# Altium project Base V3.PrjPcb
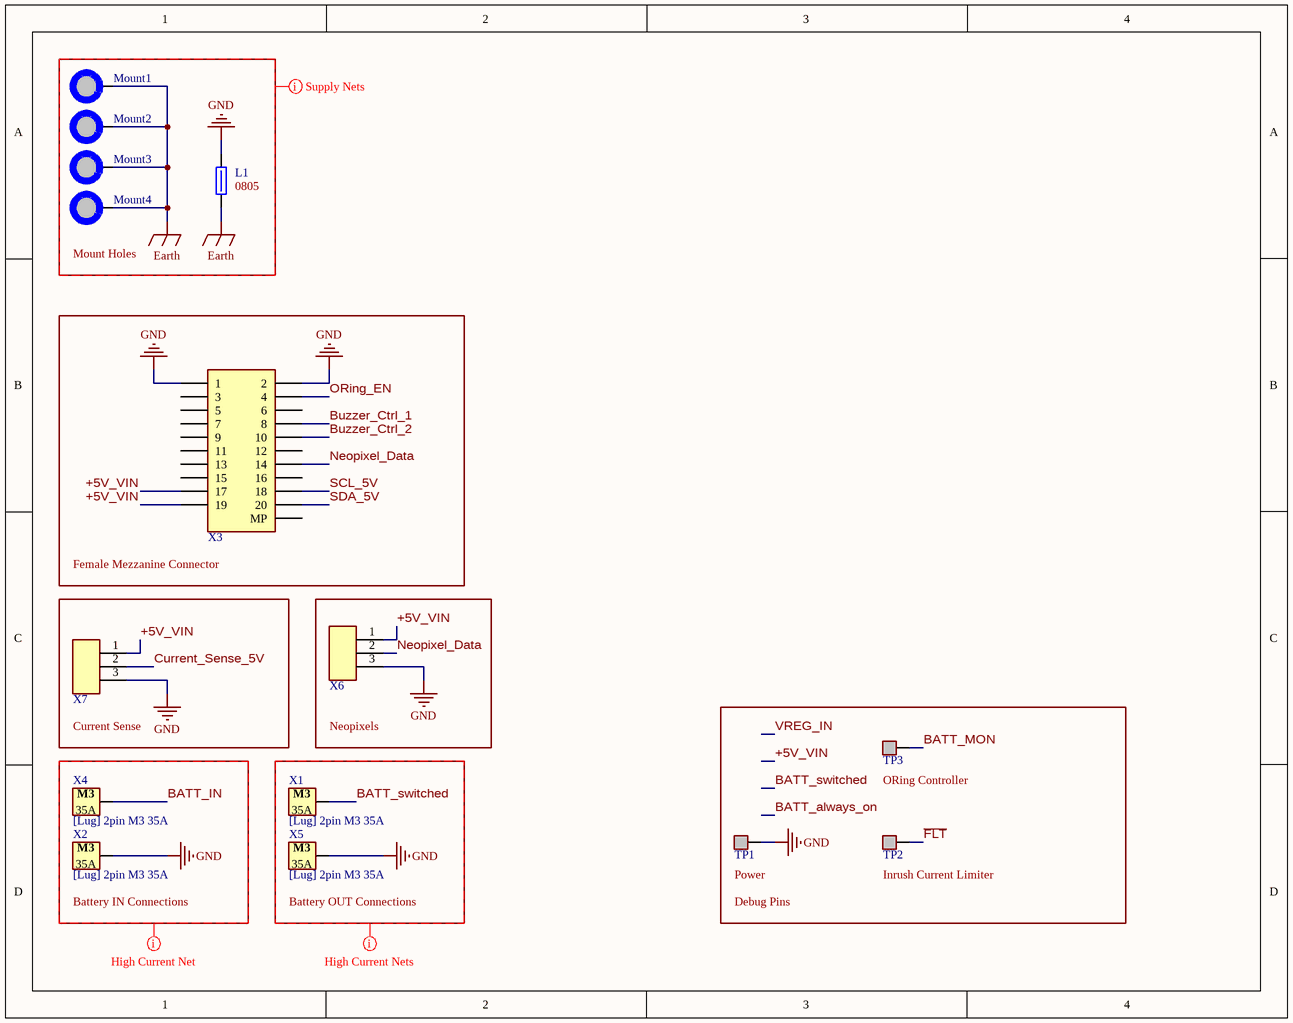
[diagram p0: Connections.SchDoc]
5 sheets, 69 parts. Net scope: global (net labels, ports and power ports of the same name join across sheets).
Board file: Layout.PcbDoc
Sheets:
  Connections.SchDoc
  Power.SchDoc
  ORing.SchDoc
  Buzzer.SchDoc
  Current Sensor ADC.SchDoc

## Sheet Connections.SchDoc
size A; SheetNumber: 1; SheetTotal: 5

### Parts
L1  Size Package: 0805  [[Ferrite] SMD 0805]  (hidden comment: 652-MH2029-300Y)
Mount1  M3 Mount Hole  [[Mount] M3 Mount Hole]  (value not drawn)  (no BOM)
Mount2  M3 Mount Hole  [[Mount] M3 Mount Hole]  (value not drawn)  (no BOM)
Mount3  M3 Mount Hole  [[Mount] M3 Mount Hole]  (value not drawn)  (no BOM)
Mount4  M3 Mount Hole  [[Mount] M3 Mount Hole]  (value not drawn)  (no BOM)
TP1  [THM] Thru-Hole  [[THM] White]  (value not drawn)
TP2  [THM] Thru-Hole  [[THM] White]  (value not drawn)
TP3  [THM] Thru-Hole  [[THM] White]  (value not drawn)
X1  [Lug] 2pin M3 35A  [[Lug] 2pin M3 35A]
X2  [Lug] 2pin M3 35A  [[Lug] 2pin M3 35A]
X3  [Mezzanine] 20pin 0.4mm Female  [[Mezzanine] 20pin 0.4mm Female]  (value not drawn)
X4  [Lug] 2pin M3 35A  [[Lug] 2pin M3 35A]
X5  [Lug] 2pin M3 35A  [[Lug] 2pin M3 35A]
X6  [Sherlock] 3pin 90deg  [[Sherlock] 3pin 90deg]  (value not drawn)
X7  [Sherlock] 3pin 90deg  [[Sherlock] 3pin 90deg]  (value not drawn)

### Blocks framed on the sheet
Mount Holes: L1 Mount1-Mount4
Female Mezzanine Connector: X3
Current Sense: X7
Neopixels: X6
Battery IN Connections: X2 X4
Battery OUT Connections: X1 X5

### Nets
Earth: L1.1 Mount1.1 Mount2.1 Mount3.1 Mount4.1
GND: L1.2 TP1.1 X2.1 X3.1 X3.2 X5.1 X6.3 X7.3
+5V_VIN: X3.17 X3.19 X6.1 X7.1
~{FLT}: TP2.1
BATT_IN: X4.1
BATT_MON: TP3.1
BATT_switched: X1.1
Buzzer_Ctrl_1: X3.8
Buzzer_Ctrl_2: X3.10
Current_Sense_5V: X7.2
Neopixel_Data: X3.14 X6.2
ORing_EN: X3.4
SCL_5V: X3.18
SDA_5V: X3.20

Not connected (* = marked no-connect by the designer): X3 3 5 6 7 9 11 12 13 15 16 MP

### Layout directives
net class Supply_Nets: Earth, GND
net class High_Current_Nets: BATT_IN, BATT_switched, GND

### Notes on the sheet
- (near TP3) ORing Controller
- Debug Pins
- (near TP1) Power
- (near TP2) Inrush Current Limiter

### Library data of the parts
L1 = [Ferrite] SMD 0805 3A 30ohm: Res @ Freq: 30 @ 100MHz; Supplier 1: DigiKey; Supplier Part Number 1: MH2029-300YCT-ND
Mount1-Mount4 = [Mount] M3 Mount Hole: Place at least 4.5mm from board edge. Plated.
TP1-TP3 = [THM] Thru-Hole: 5012; Supplier 1: DigiKey; Supplier Part Number 1: 36-5012-ND
X1 X2 X4 X5 = [Lug] 2pin M3 35A: AMT0230003TH0000G; Supplier 1: DigiKey; Supplier Part Number 1: 1818-AMT0230003TH0000G-ND
X3 = [Mezzanine] 20pin 0.4mm Female: DF40C-20DP-0.4V(51); System: Connector; Supplier 1: DigiKey; Supplier Part Number 1: H11618CT-ND
X6 X7 = [Sherlock] 3pin 90deg: 0353630360; Supplier 1: DigiKey; Supplier Part Number 1: WM18932-ND

## Sheet Power.SchDoc
size B; SheetNumber: 2; SheetTotal: 5
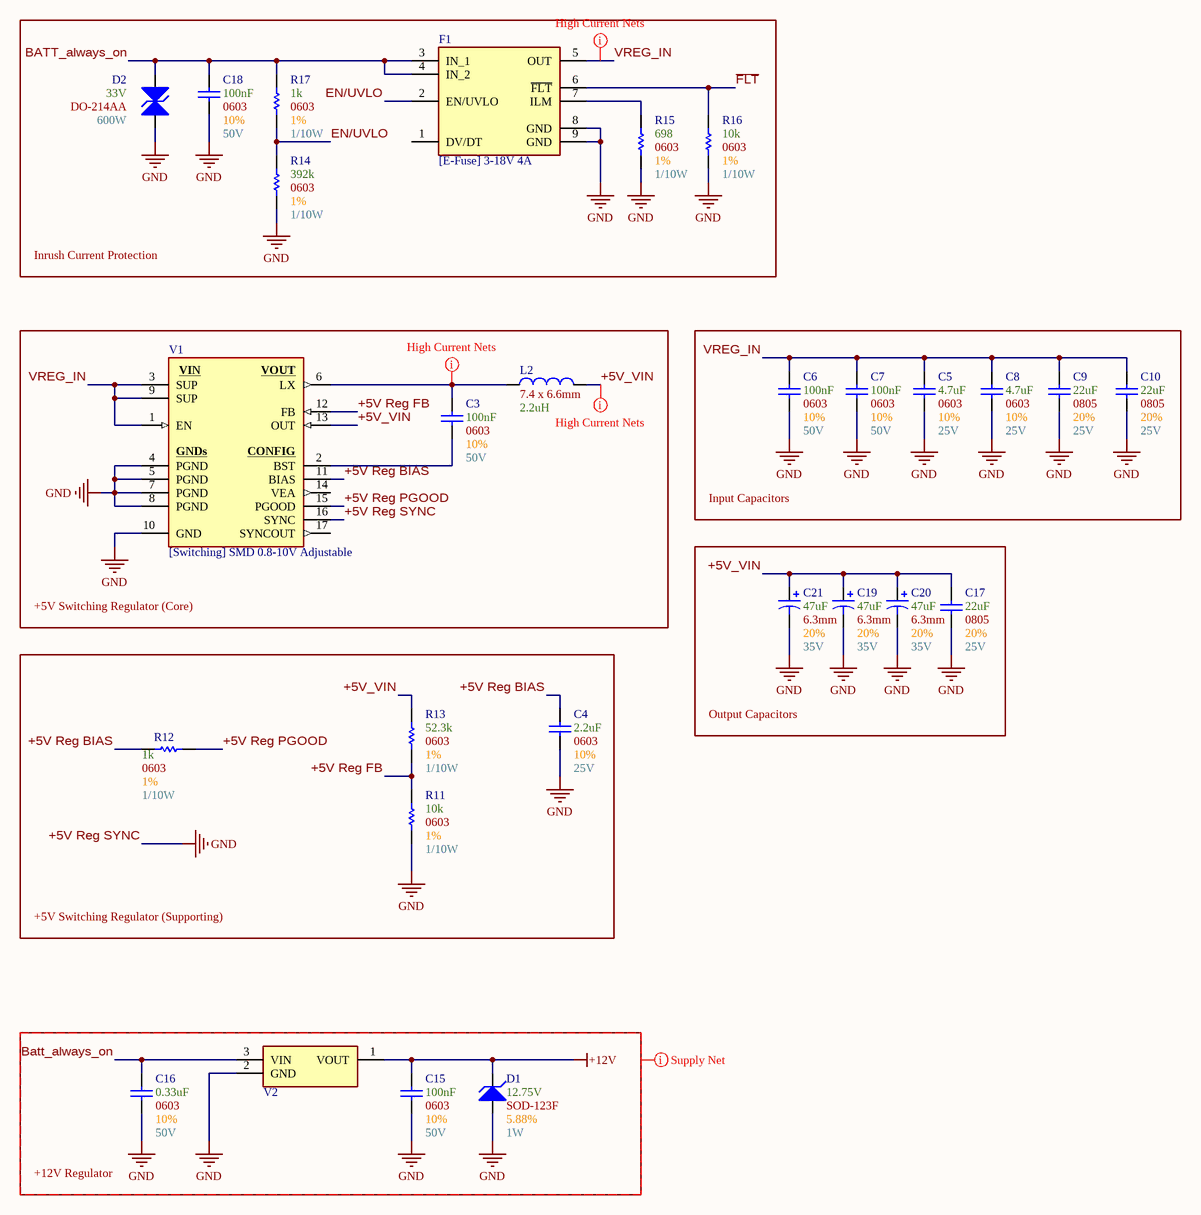
[diagram p1: Power.SchDoc]

### Parts
C3  Max Voltage: 50V  Size Package: 0603  Tolerance: 10%  Capacitance: 100nF  [[Cap] SMD 0603]  (hidden comment: [Cap] 0603 0.1uF 10% 50V)
C4  Max Voltage: 25V  Size Package: 0603  Tolerance: 10%  Capacitance: 2.2uF  [[Cap] SMD 0603]  (hidden comment: [Cap] 0603 2.2uF 10% 25V)
C5  Max Voltage: 25V  Size Package: 0603  Tolerance: 10%  Capacitance: 4.7uF  [[Cap] SMD 0603]  (hidden comment: [Cap] 0603 4.7uF 10% 25V)
C6  Max Voltage: 50V  Size Package: 0603  Tolerance: 10%  Capacitance: 100nF  [[Cap] SMD 0603]  (hidden comment: [Cap] 0603 0.1uF 10% 50V)
C7  Max Voltage: 50V  Size Package: 0603  Tolerance: 10%  Capacitance: 100nF  [[Cap] SMD 0603]  (hidden comment: [Cap] 0603 0.1uF 10% 50V)
C8  Max Voltage: 25V  Size Package: 0603  Tolerance: 10%  Capacitance: 4.7uF  [[Cap] SMD 0603]  (hidden comment: [Cap] 0603 4.7uF 10% 25V)
C9  Max Voltage: 25V  Size Package: 0805  Tolerance: 20%  Capacitance: 22uF  [[Cap] SMD 0805]  (hidden comment: [Cap] 0805 22uF 20% 25V)
C10  Max Voltage: 25V  Size Package: 0805  Tolerance: 20%  Capacitance: 22uF  [[Cap] SMD 0805]  (hidden comment: [Cap] 0805 22uF 20% 25V)
C15  Max Voltage: 50V  Size Package: 0603  Tolerance: 10%  Capacitance: 100nF  [[Cap] SMD 0603]  (hidden comment: [Cap] 0603 0.1uF 10% 50V)
C16  Max Voltage: 50V  Size Package: 0603  Tolerance: 10%  Capacitance: 0.33uF  [[Cap] SMD 0603]  (hidden comment: [Cap] 0603 0.33uF 10% 50V)
C17  Max Voltage: 25V  Size Package: 0805  Tolerance: 20%  Capacitance: 22uF  [[Cap] SMD 0805]  (hidden comment: [Cap] 0805 22uF 20% 25V)
C18  Max Voltage: 50V  Size Package: 0603  Tolerance: 10%  Capacitance: 100nF  [[Cap] SMD 0603]  (hidden comment: [Cap] 0603 0.1uF 10% 50V)
C19  Max Voltage: 35V  Size Package: 6.3mm  Tolerance: 20%  Capacitance: 47uF  [[Cap] SMD Polarized, 6.3mm]  (hidden comment: [Cap] 6.3mm 47uF 20% 35V)
C20  Max Voltage: 35V  Size Package: 6.3mm  Tolerance: 20%  Capacitance: 47uF  [[Cap] SMD Polarized, 6.3mm]  (hidden comment: [Cap] 6.3mm 47uF 20% 35V)
C21  Max Voltage: 35V  Size Package: 6.3mm  Tolerance: 20%  Capacitance: 47uF  [[Cap] SMD Polarized, 6.3mm]  (hidden comment: [Cap] 6.3mm 47uF 20% 35V)
D1  Tolerance: 5.88%  Wattage: 1W  Optimal Zener Voltage: 12.75V  [[Diode] SOD-123F]  (hidden comment: SOD-123F)
D2  Wattage: 600W  Optimal Zener Voltage: 33V  [[Diode] SMD DO-214AA]  (hidden comment: DO-214AA)
F1  [E-Fuse] 3-18V 4A  [[E-Fuse] 3-18V 4A]
L2  Package: 7.4 x 6.6mm  Inductance: 2.2uH  [[Inductor] SMD 7.4 X 6.6 X 3 MM]  (hidden comment: [2.2uH] SMD Nonstandard 10A)
R11  Wattage: 1/10W  Tolerance: 1%  Resistance: 10k  Size Package: 0603  [[Res] SMD 0603]  (hidden comment: [10k] SMD 0603 1% 1/8W)
R12  Wattage: 1/10W  Tolerance: 1%  Resistance: 1k  Size Package: 0603  [[Res] SMD 0603]  (hidden comment: [1k] SMD 0603 1% 1/10W)
R13  Wattage: 1/10W  Tolerance: 1%  Resistance: 52.3k  Size Package: 0603  [[Res] SMD 0603]  (hidden comment: [52.3k] SMD 0603 1% 1/10W)
R14  Wattage: 1/10W  Tolerance: 1%  Resistance: 392k  Size Package: 0603  [[Res] SMD 0603]  (hidden comment: [392k] SMD 0603 1% 1/10W)
R15  Wattage: 1/10W  Tolerance: 1%  Resistance: 698  Size Package: 0603  [[Res] SMD 0603]  (hidden comment: [698] SMD 0603 1% 1/10W_1)
R16  Wattage: 1/10W  Tolerance: 1%  Resistance: 10k  Size Package: 0603  [[Res] SMD 0603]  (hidden comment: [10k] SMD 0603 1% 1/8W)
R17  Wattage: 1/10W  Tolerance: 1%  Resistance: 1k  Size Package: 0603  [[Res] SMD 0603]  (hidden comment: [1k] SMD 0603 1% 1/10W)
V1  [Switching] SMD 0.8-10V Adjustable  [[Switching] 0.8-10V Adjustable Buck]
V2  [Linear] SMD 12V 0.1A  [[Linear] SMD 12V 0.1A]  (value not drawn)

### Blocks framed on the sheet
Inrush Current Protection: C18 D2 F1 R14-R17
+5V Switching Regulator (Core): C3 L2 V1
Input Capacitors: C5-C10
Output Capacitors: C17 C19-C21
+5V Switching Regulator (Supporting): C4 R11-R13
+12V Regulator: C15 C16 D1 V2

### Nets
+12V: C15.2 D1.1(K) V2.1(VOUT)
GND: C4.1 C5.1 C6.1 C7.1 C8.1 C9.1 C10.1 C15.1 C16.1 C17.1 C18.1 C19.2 C20.2 C21.2 D1.2(A) D2.1(A) F1.8(GND) F1.9(GND) R11.1 R14.1 R15.1 R16.1 V1.4(PGND) V1.5(PGND) V1.7(PGND) V1.8(PGND) V1.10(GND) V1.16(SYNC) V2.2(GND)  [also labelled +5V Reg SYNC]
+5V Reg BIAS: C4.2 R12.1 V1.11(BIAS)
+5V Reg FB: R11.2 R13.1 V1.12(FB)
+5V Reg PGOOD: R12.2 V1.15(PGOOD)
+5V_VIN: C17.2 C19.1 C20.1 C21.1 L2.2 R13.2 V1.13(OUT)
~{FLT}: F1.6(~{FLT}) R16.2
BATT_always_on: C16.2 C18.2 D2.2(K) F1.3(IN_1) F1.4(IN_2) R17.2 V2.3(VIN)
EN/UVLO: F1.2(EN/UVLO) R14.2 R17.1
VREG_IN: C5.2 C6.2 C7.2 C8.2 C9.2 C10.2 F1.5(OUT) V1.1(EN) V1.3(SUP) V1.9(SUP)
NetC3_1: C3.1 V1.2(BST)
NetC3_2: C3.2 L2.1 V1.6(LX)
NetF1_7: F1.7(ILM) R15.2

Not connected (* = marked no-connect by the designer): F1 1(DV/DT); V1 14(VEA) 17(SYNCOUT)

### Layout directives
net class High_Current_Nets: +5V_VIN, NetC3_2, VREG_IN
net class Supply_Nets: +12V, Batt_always_on, GND

### Library data of the parts
C3 C6 C7 C15 C18 = [Cap] 0603 0.1uF 10% 50V: CL10B104KB8NNNC; Supplier 1: DigiKey; Supplier Part Number 1: 1276-1000-6-ND
C4 = [Cap] 0603 2.2uF 10% 25V: GRM188R61E225KA12D; Supplier 1: DigiKey; Supplier Part Number 1: 490-10731-1-ND
C5 C8 = [Cap] 0603 4.7uF 10% 25V: GRM188R61E475KE11D; Supplier 1: DigiKey; Supplier Part Number 1: 490-7203-6-ND
C9 C10 C17 = [Cap] 0805 22uF 20% 25V: CL21A226MAYNNWE; Supplier 1: DigiKey; Supplier Part Number 1: 1276-CL21A226MAYNNWECT-ND
C16 = [Cap] 0603 0.33uF 10% 50V: CGA3E3X7R1H334K080AB; Supplier 1: DigiKey; Supplier Part Number 1: 445-174426-1-ND
C19-C21 = [Cap] 6.3mm 47uF 20% 35V: UWT1V470MCL1GS; Supplier 1: DigiKey; Supplier Part Number 1: 493-2202-1-ND
D1 = [Zener] SMD 12.75V 1W 5.88%: KDZVTR12B; Supplier 1: DigiKey; Supplier Part Number 1: KDZVTR12BCT-ND; Footprint: SOD-123F
D2 = [TVS] SMBJ33CA: SMBJ33CA; Supplier 1: DigiKey; Supplier Part Number 1: SMBJ33CA-FDICT-ND; Footprint: DO-214AA
F1 = [E-Fuse] 3-18V 4A: TPS259571DSGR; Supplier 1: DigiKey; Supplier Part Number 1: 296-50500-1-ND
L2 = [2.2uH] SMD Nonstandard 10A: ECS-MPIL0630-2R2MC; Supplier 1: DigiKey; Supplier Part Number 1: XC2402CT-ND
R11 R16 = [10k] SMD 0603 1% 1/8W: RMCF0603FT10K0; Supplier 1: DigiKey; Supplier Part Number 1: RMCF0603FT10K0DKR-ND
R12 R17 = [1k] SMD 0603 1% 1/10W: RMCF0603FT1K00; Supplier 1: DigiKey; Supplier Part Number 1: RMCF0603FT1K00DKR-ND
R13 = [52.3k] SMD 0603 1% 1/10W: RC0603FR-0752K3L; Supplier 1: DigiKey; Supplier Part Number 1: 311-52.3KHRCT-ND
R14 = [392k] SMD 0603 1% 1/10W: CR0603-FX-3923ELF; Supplier 1: DigiKey; Supplier Part Number 1: 118-CR0603-FX-3923ELFCT-ND
R15 = [698] SMD 0603 1% 1/10W_1: RMCF0603FT698R; Supplier 1: DigiKey; Supplier Part Number 1: RMCF0603FT698RCT-ND
V1 = [Switching] SMD 0.8-10V Adjustable: MAX20408AFOF/VY+; Supplier 1: DigiKey; Supplier Part Number 1: 505-MAX20408AFOF/VY+-ND
V2 = [Linear] SMD 12V 0.1A: L78L12ACUTR; Supplier 1: DigiKey; Supplier Part Number 1: 497-1195-1-ND

## Sheet ORing.SchDoc
size A; SheetNumber: 3; SheetTotal: 5
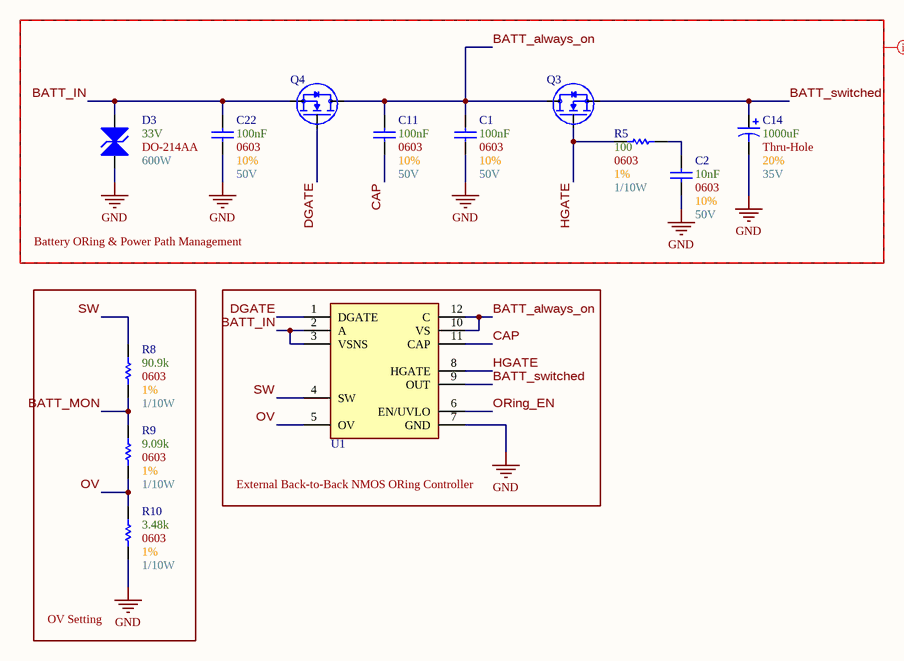
[diagram p2: ORing.SchDoc]

### Parts
C1  Max Voltage: 50V  Size Package: 0603  Tolerance: 10%  Capacitance: 100nF  [[Cap] SMD 0603]  (hidden comment: [Cap] 0603 0.1uF 10% 50V)
C2  Max Voltage: 50V  Size Package: 0603  Tolerance: 10%  Capacitance: 10nF  [[Cap] SMD 0603]  (hidden comment: [Cap] 0603 0.01uF 10% 50V)
C11  Max Voltage: 50V  Size Package: 0603  Tolerance: 10%  Capacitance: 100nF  [[Cap] SMD 0603]  (hidden comment: [Cap] 0603 0.1uF 10% 50V)
C14  Max Voltage: 35V  Size Package: Thru-Hole  Tolerance: 20%  Capacitance: 1000uF  [[Cap] Thru-Hole Polarized 10mm]  (hidden comment: [Cap] Thru-Hole 1000uF 20% 35V)
C22  Max Voltage: 50V  Size Package: 0603  Tolerance: 10%  Capacitance: 100nF  [[Cap] SMD 0603]  (hidden comment: [Cap] 0603 0.1uF 10% 50V)
D3  Wattage: 600W  Optimal Zener Voltage: 33V  [[Diode] SMD DO-214AA]  (hidden comment: DO-214AA)
Q3  [NMOS] SMD 40V 175A 0.55mOhm  [[NMOS] SMD 40V 175A 0.55mOhm]  (value not drawn)
Q4  [NMOS] SMD 40V 175A 0.55mOhm  [[NMOS] SMD 40V 175A 0.55mOhm]  (value not drawn)
R5  Wattage: 1/10W  Tolerance: 1%  Resistance: 100  Size Package: 0603  [[Res] SMD 0603]  (hidden comment: [100] SMD 0603 1% 1/10W)
R8  Wattage: 1/10W  Tolerance: 1%  Resistance: 90.9k  Size Package: 0603  [[Res] SMD 0603]  (hidden comment: [90.9k] SMD 0603 1% 1/10W)
R9  Wattage: 1/10W  Tolerance: 1%  Resistance: 9.09k  Size Package: 0603  [[Res] SMD 0603]  (hidden comment: [9.09k] SMD 0603 1% 1/10W)
R10  Wattage: 1/10W  Tolerance: 1%  Resistance: 3.48k  Size Package: 0603  [[Res] SMD 0603]  (hidden comment: [3.48k] SMD 0603 1% 1/10W_1)
U1  [ORing] Back-to-Back External NMOS Controller  [[ORing] Back-to-Back External NMOS Controller]  (value not drawn)

### Blocks framed on the sheet
Battery ORing & Power Path Management: C1 C2 C11 C14 C22 D3 Q3 Q4 R5
OV Setting: R8-R10
External Back-to-Back NMOS ORing Controller: U1

### Nets
GND: C1.1 C2.1 C14.2 C22.1 D3.1(A) R10.2 U1.7(GND)
BATT_always_on: C1.2 C11.2 Q3.3(Drain) Q4.3(Drain) U1.10(VS) U1.12(C)
BATT_IN: C22.2 D3.2(K) Q4.1(Source) U1.2(A) U1.3(VSNS)
BATT_MON: R8.1 R9.2
BATT_switched: C14.1 Q3.1(Source) U1.9(OUT)
CAP: C11.1 U1.11(CAP)
DGATE: Q4.2(Gate) U1.1(DGATE)
HGATE: Q3.2(Gate) R5.1 U1.8(HGATE)
ORing_EN: U1.6(EN/UVLO)
OV: R9.1 R10.1 U1.5(OV)
SW: R8.2 U1.4(SW)
NetC2_2: C2.2 R5.2

### Layout directives
net class High_Current_Nets: BATT_always_on, BATT_IN, BATT_switched, CAP, DGATE, GND, HGATE

### Library data of the parts
C1 C11 C22 = [Cap] 0603 0.1uF 10% 50V: CL10B104KB8NNNC; Supplier 1: DigiKey; Supplier Part Number 1: 1276-1000-6-ND
C2 = [Cap] 0603 0.01uF 10% 50V: C0603C103K5RACTU; Supplier 1: DigiKey; Supplier Part Number 1: 399-C0603C103K5RACTUDKR-ND
C14 = [Cap] Thru-Hole 1000uF 20% 35V: 35PK1000MEFC10X20; Supplier 1: DigiKey; Supplier Part Number 1: 1189-1742-ND
D3 = [TVS] SMBJ33CA: SMBJ33CA; Supplier 1: DigiKey; Supplier Part Number 1: SMBJ33CA-FDICT-ND; Footprint: DO-214AA
Q3 Q4 = [NMOS] SMD 40V 175A 0.55mOhm: IAUCN04S7N005ATMA1; Supplier 1: DigiKey; Supplier Part Number 1: 448-IAUCN04S7N005ATMA1CT-ND
R5 = [100] SMD 0603 1% 1/10W: RC0603FR-07100RL; Supplier 1: DigiKey; Supplier Part Number 1: 311-100HRDKR-ND
R8 = [90.9k] SMD 0603 1% 1/10W: CR0603-FX-9092ELF; Supplier 1: DigiKey; Supplier Part Number 1: CR0603-FX-9092ELFCT-ND
R9 = [9.09k] SMD 0603 1% 1/10W: RMCF0603FT9K09; Supplier 1: DigiKey; Supplier Part Number 1: RMCF0603FT9K09CT-ND
R10 = [3.48k] SMD 0603 1% 1/10W_1: RMCF0603FT3K48; Supplier 1: DigiKey; Supplier Part Number 1: RMCF0603FT3K48CT-ND
U1 = [ORing] Back-to-Back External NMOS Controller: LM74810QDRRRQ1; Supplier 1: DigiKey; Supplier Part Number 1: 296-LM74810QDRRRQ1CT-ND

## Sheet Buzzer.SchDoc
size A; SheetNumber: 4; SheetTotal: 5
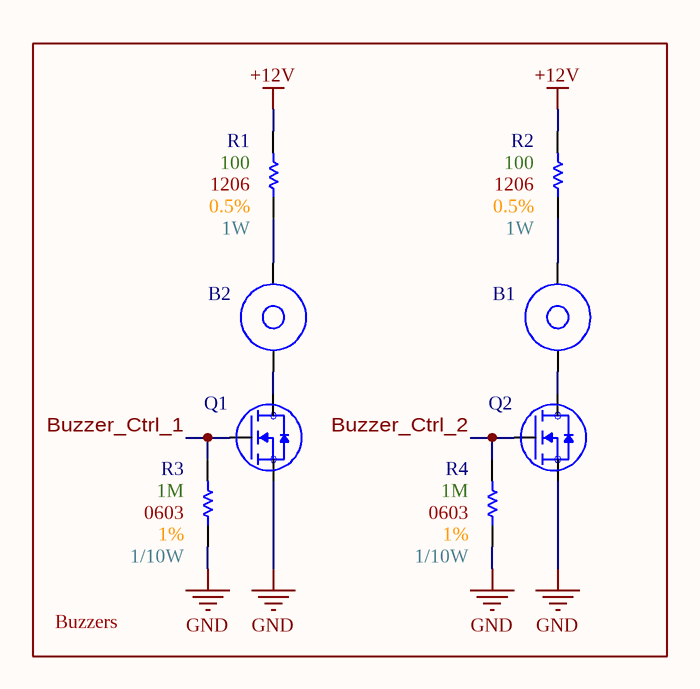
[diagram p3: Buzzer.SchDoc]

### Parts
B1  Passive buzzer  [[Buzzer] Passive SMD 12V 80mA]  (value not drawn)
B2  Passive buzzer  [[Buzzer] Passive SMD 12V 80mA]  (value not drawn)
Q1  [NMOS] SMD 20V 1.4A 160mOhm  [SOT323]  (value not drawn)
Q2  [NMOS] SMD 20V 1.4A 160mOhm  [SOT323]  (value not drawn)
R1  Wattage: 1W  Tolerance: 0.5%  Resistance: 100  Size Package: 1206  [[Res] SMD 1206]  (hidden comment: [100] SMD 1206 0.5% 1W)
R2  Wattage: 1W  Tolerance: 0.5%  Resistance: 100  Size Package: 1206  [[Res] SMD 1206]  (hidden comment: [100] SMD 1206 0.5% 1W)
R3  Wattage: 1/10W  Tolerance: 1%  Resistance: 1M  Size Package: 0603  [[Res] SMD 0603]  (hidden comment: [1M] SMD 0603 1% 1/10W)
R4  Wattage: 1/10W  Tolerance: 1%  Resistance: 1M  Size Package: 0603  [[Res] SMD 0603]  (hidden comment: [1M] SMD 0603 1% 1/10W)

### Blocks framed on the sheet
Buzzers: B1 B2 Q1 Q2 R1-R4

### Nets
+12V: R1.2 R2.2
GND: Q1.2(Source) Q2.2(Source) R3.1 R4.1
Buzzer_Ctrl_1: Q1.1(Gate) R3.2
Buzzer_Ctrl_2: Q2.1(Gate) R4.2
NetB1_1: B1.1(+) R2.1
NetB1_2: B1.2(-) Q2.3(Drain)
NetB2_1: B2.1(+) R1.1
NetB2_2: B2.2(-) Q1.3(Drain)

### Library data of the parts
B1 B2 = [Buzzer] Passive SMD 12V 80mA: CT08E-16S400-2; Supplier 1: DigiKey; Supplier Part Number 1: 2603-CT08E-16S400-2CT-ND
Q1 Q2 = [NMOS] SMD 20V 1.4A 160mOhm: BSS816NWH6327XTSA1; Supplier 1: DigiKey; Supplier Part Number 1: BSS816NWH6327XTSA1CT-ND
R1 R2 = [100] SMD 1206 0.5% 1W: HRG3216P-1000-D-T1; Supplier 1: DigiKey; Supplier Part Number 1: 408-1865-1-ND
R3 R4 = [1M] SMD 0603 1% 1/10W: RC0603FR-071ML; Supplier 1: DigiKey; Supplier Part Number 1: 311-1.00MHRDKR-ND

## Sheet Current Sensor ADC.SchDoc
size A; SheetNumber: 5; SheetTotal: 5
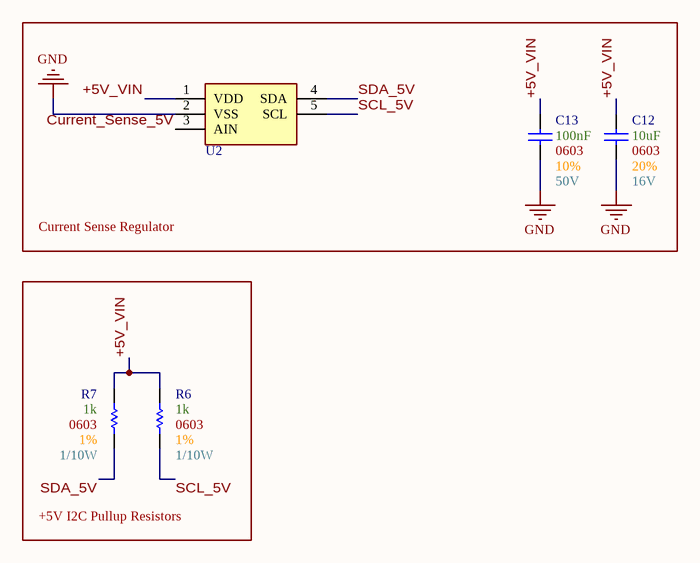
[diagram p4: Current Sensor ADC.SchDoc]

### Parts
C12  Max Voltage: 16V  Size Package: 0603  Tolerance: 20%  Capacitance: 10uF  [[Cap] SMD 0603]  (hidden comment: [Cap] 0603 10uF 20% 16V)
C13  Max Voltage: 50V  Size Package: 0603  Tolerance: 10%  Capacitance: 100nF  [[Cap] SMD 0603]  (hidden comment: [Cap] 0603 0.1uF 10% 50V)
R6  Wattage: 1/10W  Tolerance: 1%  Resistance: 1k  Size Package: 0603  [[Res] SMD 0603]  (hidden comment: [1k] SMD 0603 1% 1/10W)
R7  Wattage: 1/10W  Tolerance: 1%  Resistance: 1k  Size Package: 0603  [[Res] SMD 0603]  (hidden comment: [1k] SMD 0603 1% 1/10W)
U2  [ADC] 2.7-5.5V 12bit Single-Ended  [[ADC] 2.7-5.5V 12bit Single-Ended]  (value not drawn)

### Blocks framed on the sheet
Current Sense Regulator: C12 C13 U2
+5V I2C Pullup Resistors: R6 R7

### Nets
GND: C12.1 C13.1 U2.2(VSS)
+5V_VIN: C12.2 C13.2 R6.2 R7.2 U2.1(VDD)
Current_Sense_5V: U2.3(AIN)
SCL_5V: R6.1 U2.5(SCL)
SDA_5V: R7.1 U2.4(SDA)

### Library data of the parts
C12 = [Cap] 0603 10uF 20% 16V: GRM188C81C106MA73D; Supplier 1: DigiKey; Supplier Part Number 1: 490-7198-1-ND
C13 = [Cap] 0603 0.1uF 10% 50V: CL10B104KB8NNNC; Supplier 1: DigiKey; Supplier Part Number 1: 1276-1000-6-ND
R6 R7 = [1k] SMD 0603 1% 1/10W: RMCF0603FT1K00; Supplier 1: DigiKey; Supplier Part Number 1: RMCF0603FT1K00DKR-ND
U2 = [ADC] 2.7-5.5V 12bit Single-Ended: MCP3221A0T-E/OT; Supplier 1: DigiKey; Supplier Part Number 1: MCP3221A0T-E/OTCT-ND

## Nets that join several sheets
+12V: Power (C15.2 D1.1 V2.1), Buzzer (R1.2 R2.2)
GND: Connections (8 pins), Power (29 pins), ORing (7 pins), Buzzer (Q1.2 Q2.2 R3.1 R4.1), Current Sensor ADC (C12.1 C13.1 U2.2)
+5V_VIN: Connections (X3.17 X3.19 X6.1 X7.1), Power (7 pins), Current Sensor ADC (5 pins)
~{FLT}: Connections (TP2.1), Power (F1.6 R16.2)
BATT_always_on: Power (7 pins), ORing (6 pins)
BATT_IN: Connections (X4.1), ORing (5 pins)
BATT_MON: Connections (TP3.1), ORing (R8.1 R9.2)
BATT_switched: Connections (X1.1), ORing (C14.1 Q3.1 U1.9)
Buzzer_Ctrl_1: Connections (X3.8), Buzzer (Q1.1 R3.2)
Buzzer_Ctrl_2: Connections (X3.10), Buzzer (Q2.1 R4.2)
Current_Sense_5V: Connections (X7.2), Current Sensor ADC (U2.3)
ORing_EN: Connections (X3.4), ORing (U1.6)
SCL_5V: Connections (X3.18), Current Sensor ADC (R6.1 U2.5)
SDA_5V: Connections (X3.20), Current Sensor ADC (R7.1 U2.4)